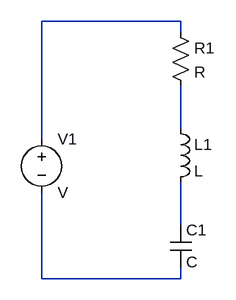
[diagram p0: schematic C10.asc]
C10.asc, the LTspice schematic file:
Version 4
SHEET 1 880 680
WIRE 288 0 80 0
WIRE 288 16 288 0
WIRE 288 160 288 96
WIRE 80 176 80 0
WIRE 288 304 288 240
WIRE 80 384 80 256
WIRE 288 384 288 368
WIRE 288 384 80 384
SYMBOL res 272 0 R0
SYMATTR InstName R1
SYMBOL ind 272 144 R0
SYMATTR InstName L1
SYMBOL cap 272 304 R0
SYMATTR InstName C1
SYMBOL voltage 80 160 R0
SYMATTR InstName V1

The netlist it stands for:
* C10.asc
R1 N001 N002 R
L1 N002 N003 L
C1 N003 N004 C
V1 N001 N004 V
.backanno
.end